# Altium schematic sheet 21_Radar_input_and_reference.SchDoc
size 289 x 396 mm
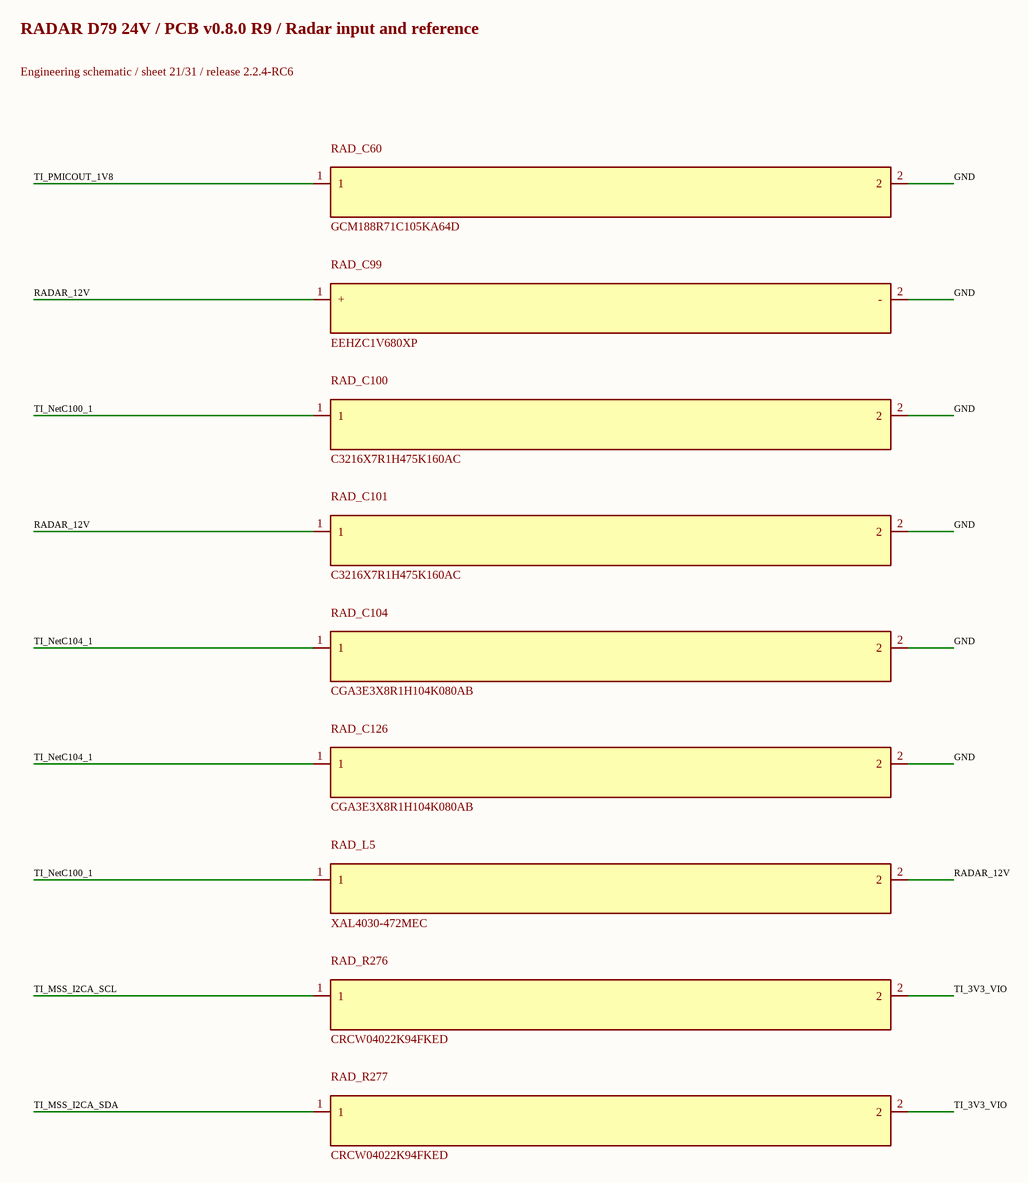
[diagram p0: 21_Radar_input_and_reference.SchDoc]

## Parts
RAD_C60  GCM188R71C105KA64D  [0603L]
RAD_C99  EEHZC1V680XP  [SM_RADIAL_6.3BMM]
RAD_C100  C3216X7R1H475K160AC  [1206_180L]
RAD_C101  C3216X7R1H475K160AC  [1206_180L]
RAD_C104  CGA3E3X8R1H104K080AB  [0603L]
RAD_C126  CGA3E3X8R1H104K080AB  [0603L]
RAD_L5  XAL4030-472MEC  [FP-XAL4030-472MEC_SMD2-MFG]
RAD_R276  CRCW04022K94FKED  [0402L]
RAD_R277  CRCW04022K94FKED  [0402L]

## Nets
GND: RAD_C60.2 RAD_C99.2(-) RAD_C100.2 RAD_C101.2 RAD_C104.2 RAD_C126.2
RADAR_12V: RAD_C99.1(+) RAD_C101.1 RAD_L5.2
TI_3V3_VIO: RAD_R276.2 RAD_R277.2
TI_MSS_I2CA_SCL: RAD_R276.1
TI_MSS_I2CA_SDA: RAD_R277.1
TI_NetC100_1: RAD_C100.1 RAD_L5.1
TI_NetC104_1: RAD_C104.1 RAD_C126.1
TI_PMICOUT_1V8: RAD_C60.1

## Notes on the sheet
- RADAR D79 24V / PCB v0.8.0 R9 / Radar input and reference
- Engineering schematic / sheet 21/31 / release 2.2.4-RC6